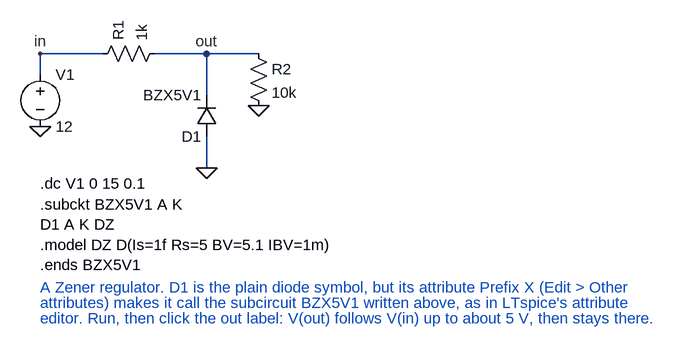
[diagram p0: schematic zener_prefix.asc]
zener_prefix.asc, the LTspice schematic file:
Version 4
SHEET 1 880 680
WIRE 0 96 0 64
WIRE 0 64 96 64
WIRE 176 64 256 64
WIRE 256 64 336 64
WIRE 256 64 256 128
WIRE 256 192 256 240
FLAG 0 64 in
FLAG 256 64 out
FLAG 0 176 0
FLAG 256 240 0
FLAG 336 144 0
SYMBOL voltage 0 80 R0
SYMATTR InstName V1
SYMATTR Value 12
SYMBOL res 80 80 R270
SYMATTR InstName R1
SYMATTR Value 1k
SYMBOL diode 272 192 R180
SYMATTR InstName D1
SYMATTR Value BZX5V1
SYMATTR Prefix X
SYMBOL res 320 48 R0
SYMATTR InstName R2
SYMATTR Value 10k
TEXT 0 264 Left 2 !.dc V1 0 15 0.1
TEXT 0 296 Left 2 !.subckt BZX5V1 A K\nD1 A K DZ\n.model DZ D(Is=1f Rs=5 BV=5.1 IBV=1m)\n.ends BZX5V1
TEXT 0 424 Left 2 ;A Zener regulator. D1 is the plain diode symbol, but its attribute Prefix X (Edit > Other
TEXT 0 448 Left 2 ;attributes) makes it call the subcircuit BZX5V1 written above, as in LTspice's attribute
TEXT 0 472 Left 2 ;editor. Run, then click the out label: V(out) follows V(in) up to about 5 V, then stays there.

The netlist it stands for:
* zener_prefix.asc
V1 in 0 12
R1 in out 1k
XD1 0 out BZX5V1  ; pins + -
R2 out 0 10k
.dc V1 0 15 0.1
.subckt BZX5V1 A K
D1 A K DZ
.model DZ D(Is=1f Rs=5 BV=5.1 IBV=1m)
.ends BZX5V1
* A Zener regulator. D1 is the plain diode symbol, but its attribute Prefix X (Edit > Other
* attributes) makes it call the subcircuit BZX5V1 written above, as in LTspice's attribute
* editor. Run, then click the out label: V(out) follows V(in) up to about 5 V, then stays there.
.backanno
.end